# Altium schematic sheet MCU_Core.SchDoc: Skipper MCU Core
size 297 x 210 mm; Author: Jack Herron; SheetNumber: 3; SheetTotal: 11
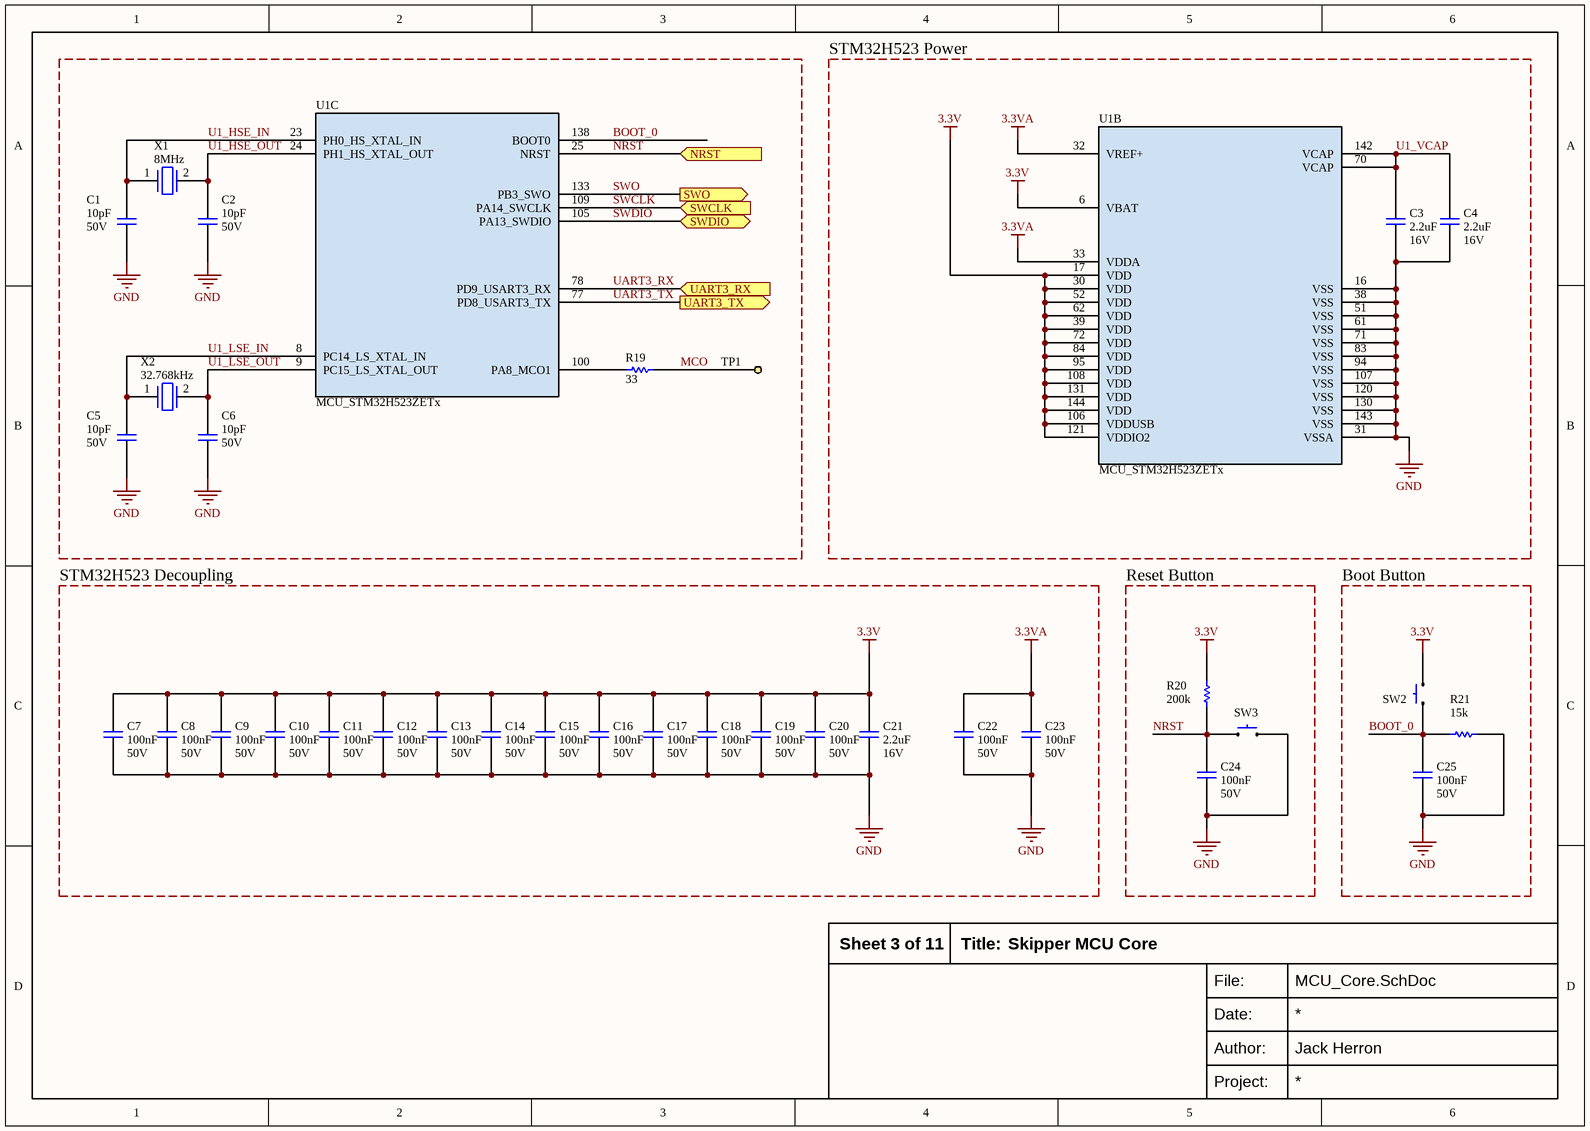
[diagram p0: MCU_Core.SchDoc]

## Parts
C1  value 10pF  Voltage: 50V  [CAPACITOR-0402]  (hidden comment: CL05C100JB5NNNC)
C2  value 10pF  Voltage: 50V  [CAPACITOR-0402]  (hidden comment: CL05C100JB5NNNC)
C3  value 2.2uF  Voltage: 16V  [CAPACITOR-0603]  (hidden comment: CL10A225KO8NNNC)
C4  value 2.2uF  Voltage: 16V  [CAPACITOR-0603]  (hidden comment: CL10A225KO8NNNC)
C5  value 10pF  Voltage: 50V  [CAPACITOR-0402]  (hidden comment: CL05C100JB5NNNC)
C6  value 10pF  Voltage: 50V  [CAPACITOR-0402]  (hidden comment: CL05C100JB5NNNC)
C7  value 100nF  Voltage: 50V  [CAPACITOR-0402]  (hidden comment: CL05B104KB54PNC)
C8  value 100nF  Voltage: 50V  [CAPACITOR-0402]  (hidden comment: CL05B104KB54PNC)
C9  value 100nF  Voltage: 50V  [CAPACITOR-0402]  (hidden comment: CL05B104KB54PNC)
C10  value 100nF  Voltage: 50V  [CAPACITOR-0402]  (hidden comment: CL05B104KB54PNC)
C11  value 100nF  Voltage: 50V  [CAPACITOR-0402]  (hidden comment: CL05B104KB54PNC)
C12  value 100nF  Voltage: 50V  [CAPACITOR-0402]  (hidden comment: CL05B104KB54PNC)
C13  value 100nF  Voltage: 50V  [CAPACITOR-0402]  (hidden comment: CL05B104KB54PNC)
C14  value 100nF  Voltage: 50V  [CAPACITOR-0402]  (hidden comment: CL05B104KB54PNC)
C15  value 100nF  Voltage: 50V  [CAPACITOR-0402]  (hidden comment: CL05B104KB54PNC)
C16  value 100nF  Voltage: 50V  [CAPACITOR-0402]  (hidden comment: CL05B104KB54PNC)
C17  value 100nF  Voltage: 50V  [CAPACITOR-0402]  (hidden comment: CL05B104KB54PNC)
C18  value 100nF  Voltage: 50V  [CAPACITOR-0402]  (hidden comment: CL05B104KB54PNC)
C19  value 100nF  Voltage: 50V  [CAPACITOR-0402]  (hidden comment: CL05B104KB54PNC)
C20  value 100nF  Voltage: 50V  [CAPACITOR-0402]  (hidden comment: CL05B104KB54PNC)
C21  value 2.2uF  Voltage: 16V  [CAPACITOR-0603]  (hidden comment: CL10A225KO8NNNC)
C22  value 100nF  Voltage: 50V  [CAPACITOR-0402]  (hidden comment: CL05B104KB54PNC)
C23  value 100nF  Voltage: 50V  [CAPACITOR-0402]  (hidden comment: CL05B104KB54PNC)
C24  value 100nF  Voltage: 50V  [CAPACITOR-0402]  (hidden comment: CL05B104KB54PNC)
C25  value 100nF  Voltage: 50V  [CAPACITOR-0402]  (hidden comment: CL05B104KB54PNC)
R19  value 33  [RESISTOR-0402]  (hidden comment: 0402WGF330JTCE)
R20  value 200k  [RESISTOR-0402]  (hidden comment: 0402WGF2003TCE)
R21  value 15k  [RESISTOR-0402]  (hidden comment: 0402WGF1502TCE)
SW2  TS-1088-AR02016  [TACTILE-SWITCH_TS-1088-AR02016]  (value not drawn)
SW3  TS-1088-AR02016  [TACTILE-SWITCH_TS-1088-AR02016]  (value not drawn)
TP1  Test Point 1mm  [TESTPOINT_1mm]  (value not drawn)  (no BOM)
U1  MCU_STM32H523ZETx  [LQFP-144-22x22]  (parts B,C of 3)
X1  value 8MHz  [CRYSTAL_3225-2P]  (hidden comment: NX3225GD-8MHZ-STD-CRA-3)
X2  value 32.768kHz  [CRYSTAL_3215-2P]  (hidden comment: FC-135 32.7680KA-AG3)

## Blocks framed on the sheet
STM32H523 Power: C3 C4 U1
STM32H523 Decoupling: C7-C23
Reset Button: C24 R20 SW3
Boot Button: C25 R21 SW2

## Ports
NRST (in, see Top_Sheet[3C]), SWCLK (in, see Top_Sheet[3C]), SWDIO (bidir, see Top_Sheet[3C]), SWO (out, see Top_Sheet[3C]), UART3_RX (in, see Top_Sheet[3C]), UART3_TX (out, see Top_Sheet[3C])

## Nets
3.3V: C7.2 C8.2 C9.2 C10.2 C11.2 C12.2 C13.2 C14.2 C15.2 C16.2 C17.2 C18.2 C19.2 C20.2 C21.2 R20.2 SW2.2 U1.6(VBAT) U1.17(VDD) U1.30(VDD) U1.39(VDD) U1.52(VDD) U1.62(VDD) U1.72(VDD) U1.84(VDD) U1.95(VDD) U1.106(VDDUSB) U1.108(VDD) U1.121(VDDIO2) U1.131(VDD) U1.144(VDD)
3.3VA: C22.2 C23.2 U1.32(VREF+) U1.33(VDDA)
GND: C1.1 C2.1 C3.1 C4.1 C5.1 C6.1 C7.1 C8.1 C9.1 C10.1 C11.1 C12.1 C13.1 C14.1 C15.1 C16.1 C17.1 C18.1 C19.1 C20.1 C21.1 C22.1 C23.1 C24.1 C25.1 R21.1 SW3.2 U1.16(VSS) U1.31(VSSA) U1.38(VSS) U1.51(VSS) U1.61(VSS) U1.71(VSS) U1.83(VSS) U1.94(VSS) U1.107(VSS) U1.120(VSS) U1.130(VSS) U1.143(VSS)
BOOT_0: C25.2 R21.2 SW2.1 U1.138(BOOT0)
MCO: R19.1 TP1.1
NRST: C24.2 R20.1 SW3.1 U1.25(NRST) ; port NRST
SWCLK: U1.109(PA14_SWCLK) ; port SWCLK
SWDIO: U1.105(PA13_SWDIO) ; port SWDIO
SWO: U1.133(PB3_SWO) ; port SWO
U1_HSE_IN: C1.2 U1.23(PH0_HS_XTAL_IN) X1.1
U1_HSE_OUT: C2.2 U1.24(PH1_HS_XTAL_OUT) X1.2
U1_LSE_IN: C5.2 U1.8(PC14_LS_XTAL_IN) X2.1
U1_LSE_OUT: C6.2 U1.9(PC15_LS_XTAL_OUT) X2.2
U1_VCAP: C3.2 C4.2 U1.70(VCAP) U1.142(VCAP)
UART3_RX: U1.78(PD9_USART3_RX) ; port UART3_RX
UART3_TX: U1.77(PD8_USART3_TX) ; port UART3_TX
NetR19_2: R19.2 U1.100(PA8_MCO1)

## Notes on the sheet
- Title:
- File:
- Date:
- Project:
- Author:

## Library data of the parts
C1 C2 C5 C6 = CAPACITOR_CL05C100JB5NNNC: Capacitor - 10pF - 50V - 0402 - C0G; Manufacturer 1: Samsung; Manufacturer Part Number 1: CL05C100JB5NNNC; Supplier 1: LCSC; Supplier Part Number 1: C32949
C3 C4 C21 = CAPACITOR_CL10A225KO8NNNC: Capacitor - 2.2uF - 16V - 0603 - X5R; Manufacturer 1: Samsung; Manufacturer Part Number 1: CL10A225KO8NNNC; Supplier 1: LCSC; Supplier Part Number 1: C23630
C7-C20 C22-C25 = CAPACITOR_CL05B104KB54PNC: Capacitor - 100nF - 50V - 0402 - X7R; Manufacturer 1: Samsung; Manufacturer Part Number 1: CL05B104KB54PNC; Supplier 1: LCSC; Supplier Part Number 1: C307331
R19 = RESISTOR_0402WGF330JTCE: Resistor - 33 -0402; Manufacturer 1: UNI-ROYAL(Uniroyal Elec); Voltage: 50V; Wattage: 62.5mW; Manufacturer Part Number 1: 0402WGF330JTCE; Supplier 1: LCSC; Supplier Part Number 1: C25105
R20 = RESISTOR_0402WGF2003TCE: Resistor - 200k - 0402; Manufacturer 1: UNI-ROYAL; Wattage: 62.5mW; Voltage: 50V; Manufacturer Part Number 1: 0402WGF2003TCE; Supplier 1: LCSC; Supplier Part Number 1: C25764
R21 = RESISTOR_0402WGF1502TCE: Resistor - 15k - 0402; Manufacturer 1: UNI-ROYAL; Voltage: 50V; Wattage: 62.5mW; Manufacturer Part Number 1: 0402WGF1502TCE; Supplier 1: LCSC; Supplier Part Number 1: C25756
SW2 SW3 = SWITCH_Tactile_TS-1088-AR02016: Push button; Manufacturer 1: XUNPU; Supplier 1: LCSC; Supplier Part Number 1: C720477; Manufacturer Part Number 1: TS-1088-AR02016
TP1 = TESTPOINT_1mm: TestPoint 1mm
U1 = MCU_STM32H523ZETx: Arm Cortex-M33 MCU - 512KB Flash - 272KB SRAM - 250 MHz - LQFP144; Manufacturer 1: ST; Manufacturer Part Number 1: STM32H523ZET6; Supplier 1: Mouser; Supplier Part Number 1: 511-STM32H523ZET6
X1 = CRYSTAL_NX3225GD-8MHZ-STD-CRA-3: 8Mhz crystal 3225-2P; Manufacturer 1: NDK; Manufacturer Part Number 1: NX3225GD-8MHZ-STD-CRA-3; Supplier 1: LCSC; Supplier Part Number 1: C889706
X2 = CRYSTAL_FC-135 32.7680KA-AG3: 32.768kHz crystal 3215-2P; Manufacturer 1: Seiko Epson; Manufacturer Part Number 1: FC-135 32.7680KA-AG3; Supplier 1: LCSC; Supplier Part Number 1: C7275970